# Altium project Stepper_Breakout.PrjPcb (part 1 of 2)
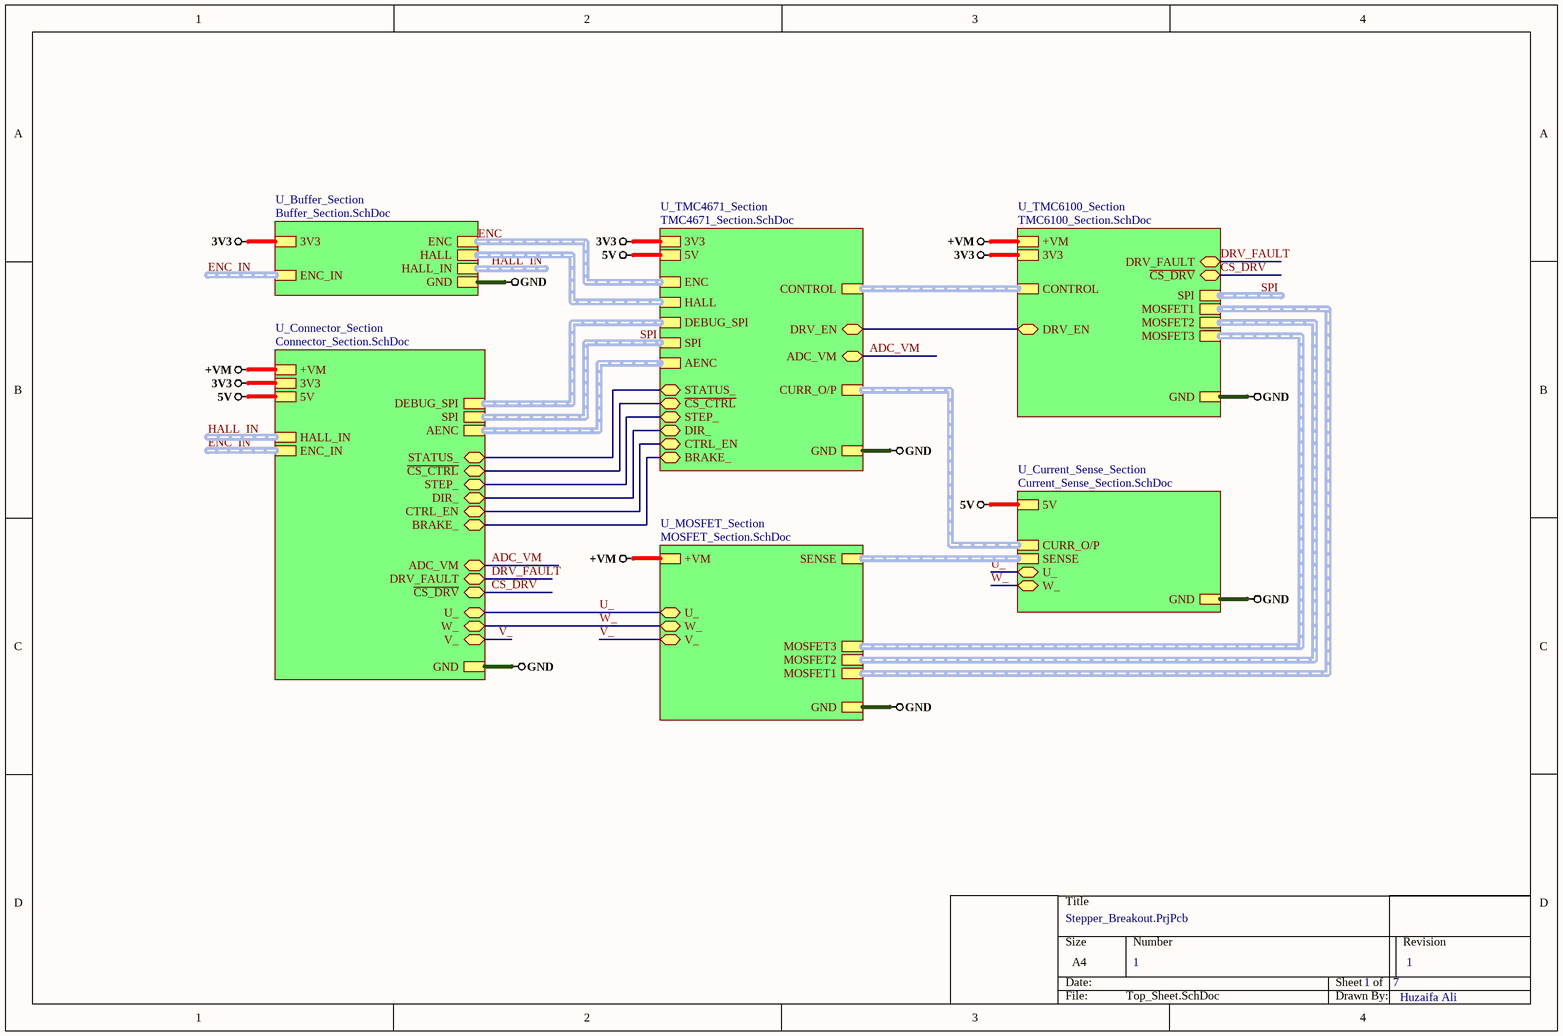
[diagram p0: Top_Sheet.SchDoc]
7 sheets, 115 parts. Net scope: hierarchical (ports join the sheet entries above them; power ports are global).
Board file: Step..._Breakout.PcbDoc
Sheets:
  Top_Sheet.SchDoc
    U_Buffer_Section = Buffer_Section.SchDoc
    U_Connector_Section = Connector_Section.SchDoc
    U_Current_Sense_Section = Current_Sense_Section.SchDoc
    U_MOSFET_Section = MOSFET_Section.SchDoc
    U_TMC4671_Section = TMC4671_Section.SchDoc
    U_TMC6100_Section = TMC6100_Section.SchDoc

## Sheet Top_Sheet.SchDoc: =Projectname
size A4; SheetNumber: 1; SheetTotal: 7

### Sub-sheets
U_Buffer_Section = Buffer_Section.SchDoc: ENC (harness ENC), HALL (harness HALL), 3V3, GND, HALL_IN (harness HALL_IN), ENC_IN (harness ENC_IN)
U_Connector_Section = Connector_Section.SchDoc: BRAKE_ (bidir), STEP_ (bidir), DIR_ (bidir), CTRL_EN (bidir), U_ (bidir), W_ (bidir), DEBUG_SPI (harness DEBUG_SPI), SPI (harness SPI), ~{CS_CTRL} (bidir), ~{CS_DRV} (bidir), STATUS_ (bidir), DRV_FAULT (bidir), AENC (harness AENC), +VM, 3V3, GND, 5V, HALL_IN (harness HALL_IN), ENC_IN (harness ENC_IN), V_ (bidir), ADC_VM (bidir)
U_Current_Sense_Section = Current_Sense_Section.SchDoc: CURR_O/P (harness CURR_O/P), 5V, GND, SENSE (harness SENSE), U_ (bidir), W_ (bidir)
U_MOSFET_Section = MOSFET_Section.SchDoc: MOSFET1 (harness MOSFET1), MOSFET2 (harness MOSFET2), MOSFET3 (harness MOSFET3), SENSE (harness SENSE), U_ (bidir), W_ (bidir), V_ (bidir), +VM, GND
U_TMC4671_Section = TMC4671_Section.SchDoc: STATUS_ (bidir), BRAKE_ (bidir), ~{CS_CTRL} (bidir), STEP_ (bidir), DIR_ (bidir), CTRL_EN (bidir), DEBUG_SPI (harness DEBUG_SPI), SPI (harness SPI), ENC (harness ENC), HALL (harness HALL), 5V, 3V3, GND, CURR_O/P (harness CURR_O/P), AENC (harness AENC), CONTROL (harness CONTROL), DRV_EN (bidir), ADC_VM (bidir)
U_TMC6100_Section = TMC6100_Section.SchDoc: SPI (harness SPI), CONTROL (harness CONTROL), DRV_FAULT (bidir), ~{CS_DRV} (bidir), MOSFET1 (harness MOSFET1), MOSFET2 (harness MOSFET2), MOSFET3 (harness MOSFET3), DRV_EN (bidir), +VM, 3V3, GND

### Nets
3V3: sheet U_Buffer_Section/3V3, sheet U_Connector_Section/3V3, sheet U_TMC4671_Section/3V3, sheet U_TMC6100_Section/3V3
5V: sheet U_Connector_Section/5V, sheet U_Current_Sense_Section/5V, sheet U_TMC4671_Section/5V
+VM: sheet U_Connector_Section/+VM, sheet U_MOSFET_Section/+VM, sheet U_TMC6100_Section/+VM
GND: sheet U_Buffer_Section/GND, sheet U_Connector_Section/GND, sheet U_Current_Sense_Section/GND, sheet U_MOSFET_Section/GND, sheet U_TMC4671_Section/GND, sheet U_TMC6100_Section/GND
~{CS_CTRL}: sheet U_Connector_Section/~{CS_CTRL}, sheet U_TMC4671_Section/~{CS_CTRL}
~{CS_DRV}: sheet U_Connector_Section/~{CS_DRV}, sheet U_TMC6100_Section/~{CS_DRV}
ADC_VM: sheet U_Connector_Section/ADC_VM, sheet U_TMC4671_Section/ADC_VM
BRAKE_: sheet U_Connector_Section/BRAKE_, sheet U_TMC4671_Section/BRAKE_
CTRL_EN: sheet U_Connector_Section/CTRL_EN, sheet U_TMC4671_Section/CTRL_EN
DIR_: sheet U_Connector_Section/DIR_, sheet U_TMC4671_Section/DIR_
DRV_EN: sheet U_TMC4671_Section/DRV_EN, sheet U_TMC6100_Section/DRV_EN
DRV_FAULT: sheet U_Connector_Section/DRV_FAULT, sheet U_TMC6100_Section/DRV_FAULT
STATUS_: sheet U_Connector_Section/STATUS_, sheet U_TMC4671_Section/STATUS_
STEP_: sheet U_Connector_Section/STEP_, sheet U_TMC4671_Section/STEP_
U_: sheet U_Connector_Section/U_, sheet U_Current_Sense_Section/U_, sheet U_MOSFET_Section/U_
V_: sheet U_Connector_Section/V_, sheet U_MOSFET_Section/V_
W_: sheet U_Connector_Section/W_, sheet U_Current_Sense_Section/W_, sheet U_MOSFET_Section/W_

### Buses and harness runs
harness ENC = sheet U_Buffer_Section/ENC = sheet U_TMC4671_Section/ENC
harness ENC_IN = sheet U_Buffer_Section/ENC_IN
harness ENC_IN = sheet U_Connector_Section/ENC_IN
harness HALL_IN = sheet U_Buffer_Section/HALL_IN
harness HALL_IN = sheet U_Connector_Section/HALL_IN
harness sheet U_Buffer_Section/HALL = sheet U_TMC4671_Section/HALL
harness sheet U_Connector_Section/AENC = sheet U_TMC4671_Section/AENC
harness sheet U_Connector_Section/DEBUG_SPI = sheet U_TMC4671_Section/DEBUG_SPI
harness sheet U_Current_Sense_Section/CURR_O/P = sheet U_TMC4671_Section/CURR_O/P
harness sheet U_Current_Sense_Section/SENSE = sheet U_MOSFET_Section/SENSE
harness sheet U_MOSFET_Section/MOSFET1 = sheet U_TMC6100_Section/MOSFET1
harness sheet U_MOSFET_Section/MOSFET2 = sheet U_TMC6100_Section/MOSFET2
harness sheet U_MOSFET_Section/MOSFET3 = sheet U_TMC6100_Section/MOSFET3
harness sheet U_TMC4671_Section/CONTROL = sheet U_TMC6100_Section/CONTROL
harness SPI = sheet U_Connector_Section/SPI = sheet U_TMC4671_Section/SPI
harness SPI = sheet U_TMC6100_Section/SPI

### Notes on the sheet
- 1
- Huzaifa Ali

## Sheet Buffer_Section.SchDoc
size A; SheetNumber: 6; SheetTotal: 7
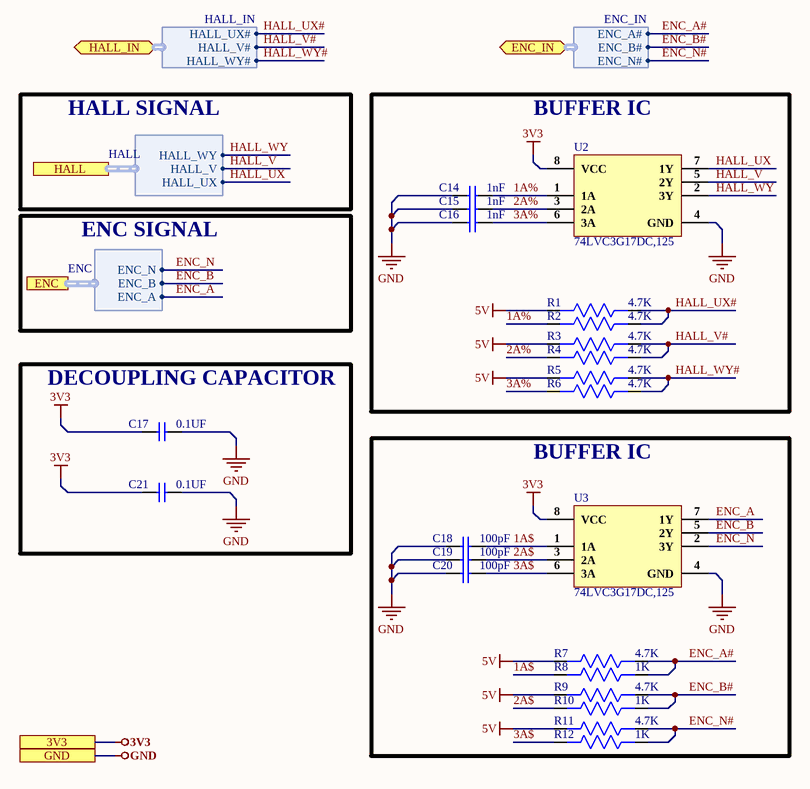
[diagram p1: Buffer_Section.SchDoc]

### Parts
C14  1nF  [Cap0603]
C15  1nF  [Cap0603]
C16  1nF  [Cap0603]
C17  0.1UF  [Cap0402]
C18  100pF  [Cap0603]
C19  100pF  [Cap0603]
C20  100pF  [Cap0603]
C21  0.1UF  [Cap0402]
R1  4.7K  [Res0603]
R2  4.7K  [Res0603]
R3  4.7K  [Res0603]
R4  4.7K  [Res0603]
R5  4.7K  [Res0603]
R6  4.7K  [Res0603]
R7  4.7K  [Res0603]
R8  1K  [Res0603]
R9  4.7K  [Res0603]
R10  1K  [Res0603]
R11  4.7K  [Res0603]
R12  1K  [Res0603]
U2  74LVC3G17DC,125  [8-VSSOP]
U3  74LVC3G17DC,125  [8-VSSOP]

### Blocks framed on the sheet
BUFFER IC: C14-C16 R1-R6 U2
DECOUPLING CAPACITOR: C17 C21
BUFFER IC: C18-C20 R7-R12 U3

### Ports
3V3, ENC (harness ENC), ENC_IN (bidir, harness ENC_IN), GND, HALL (harness HALL), HALL_IN (bidir, harness HALL_IN)

### Harnesses
ENC: ENC_N, ENC_B, ENC_A
HALL: HALL_WY, HALL_V, HALL_UX
HALL_IN: HALL_UX#, HALL_V#, HALL_WY#
ENC_IN: ENC_A#, ENC_B#, ENC_N#

### Nets
3V3: C17.1 C21.1 U2.8(VCC) U3.8(VCC) ; port 3V3
5V: R1.2 R3.2 R5.2 R7.2 R9.2 R11.2
GND: C14.1 C15.1 C16.1 C17.2 C18.1 C19.1 C20.1 C21.2 U2.4(GND) U3.4(GND) ; port GND
1A$: C18.2 R8.2 U3.1(1A)
1A%: C14.2 R2.2 U2.1(1A)
2A$: C19.2 R10.2 U3.3(2A)
2A%: C15.2 R4.2 U2.3(2A)
3A$: C20.2 R12.2 U3.6(3A)
3A%: C16.2 R6.2 U2.6(3A)
ENC_A: U3.7(1Y) ; port ENC.ENC_A  [project net ENC.ENC_A]
ENC_A#: R7.1 R8.1 ; port ENC_IN.ENC_A#
ENC_B: U3.5(2Y) ; port ENC.ENC_B  [project net ENC.ENC_B]
ENC_B#: R9.1 R10.1 ; port ENC_IN.ENC_B#
ENC_N: U3.2(3Y) ; port ENC.ENC_N  [project net ENC.ENC_N]
ENC_N#: R11.1 R12.1 ; port ENC_IN.ENC_N#  [project net ENC_IN.ENC_N#]
HALL_UX: U2.7(1Y) ; port HALL.HALL_UX
HALL_UX#: R1.1 R2.1 ; port HALL_IN.HALL_UX#  [project net HALL_IN.HALL_UX#]
HALL_V: U2.5(2Y) ; port HALL.HALL_V
HALL_V#: R3.1 R4.1 ; port HALL_IN.HALL_V#  [project net HALL_IN.HALL_V#]
HALL_WY: U2.2(3Y) ; port HALL.HALL_WY
HALL_WY#: R5.1 R6.1 ; port HALL_IN.HALL_WY#  [project net HALL_IN.HALL_WY#]

### Notes on the sheet
- HALL SIGNAL
- ENC SIGNAL

### Library data of the parts
C14-C16 = CL10B102KC8NNNC: CAP CER 1nF 100V X7R 0603; Manufacturer: Samsung; Material: Ceramic; Tolerance: 10%; Supplier 1: Avnet; Manufacturer Part Number: CL10B102KC8NNNC; RoHS: Yes; Category: Ceramic Capacitors; Stock 1: 184000; Pricing 1: 4000=0.00988, 8000=0.00987, 16000=0.00986, 24000=0.00985, 32000=0.00984, 40000=0.00982, 400000=0.00981 (USD); Mount: Surface Mount; Case/Package: 0603; Case Code (Metric): 1608; Case Code (Imperial): 0603; Contact Plating: Tin; Min Operating Temperature: -55°C; Max Operating Temperature: 125°C; Capacitance: 1nF; Dielectric: X7R; Packaging: Tape and Reel; Package Quantity: 1; Voltage Rating: 100V; Voltage: 100V; Voltage Rating (DC): 100V; Series: CL; Construction: Flat; Length: 1.6mm; Width: 0.031inch; Height: 0.8mm; Thickness: 0.035inch; Depth: 0.8mm; Radiation Hardening: No; Lead Free: Lead Free; RoHS Compliant: Yes; ComponentLink1URL: https://datasheet.ciiva.com/25799/cl10b102kc8nnnc-25799476.pdf?src-supplier=Digi-Key; ComponentLink1Description: https://datasheet.ciiva.com/25799/cl10b102kc8nnnc-25799476.pdf?src-supplier=Digi-Key; ComponentLink2URL: https://datasheet.ciiva.com/29198/458286-da-01-en-vs-kondensator-0603-29198496.pdf?src-supplier=Conrad; ComponentLink2Description: https://datasheet.ciiva.com/29198/458286-da-01-en-vs-kondensator-0603-29198496.pdf?src-supplier=Conrad; ComponentLink3URL: https://datasheet.ciiva.com/26838/getdatasheetpartid-640779-26838395.pdf?src-supplier=Verical; ComponentLink3Description: https://datasheet.ciiva.com/26838/getdatasheetpartid-640779-26838395.pdf?src-supplier=Verical; ComponentLink4URL: https://datasheet.ciiva.com/26310/mlcc-catalogdownload2013-eng-26310266.pdf?src-supplier=Distrelec; ComponentLink4Description: https://datasheet.ciiva.com/26310/mlcc-catalogdownload2013-eng-26310266.pdf?src-supplier=Distrelec; ComponentLink5URL: https://datasheet.ciiva.com/16199/cl05b104kq5nnnc-16199246.pdf?src-supplier=Future+Electronics; ComponentLink5Description: https://datasheet.ciiva.com/16199/cl05b104kq5nnnc-16199246.pdf?src-supplier=Future+Electronics; Supplier Part Number 1: CL10B102KC8NNNC
C17 C21 = CL05B104KB54PNC: CAP CER 0.1UF 50V X7R 0402; Manufacturer: Samsung; Supplier 1: Digi-Key; Manufacturer Part Number: CL05B104KB54PNC; Stock 1: 8594; Pricing 1: 1=0.1, 10=0.067, 50=0.0366, 100=0.0299, 500=0.02138, 1000=0.01681, 2500=0.01528, 5000=0.01406 (USD); Supplier Part Number 1: 1276-CL05B104KB54PNCDKR-ND
C18-C20 = GRM1885C1H101JA01D: CAP CER 100PF 50V C0G/NP0 0603; Manufacturer: Murata; Material: Ceramic; Tolerance: 5%; Dielectric: C0G; Insulation Resistance: 10GR; Temperature Coefficient: 30ppm/°C; Supplier 1: Arrow Electronics; Manufacturer Part Number: GRM1885C1H101JA01D; RoHS: Yes; Category: Ceramic Capacitors; Stock 1: 3884000; Pricing 1: 4000=0.03790, 8000=0.03760, 12000=0.03720, 40000=0.02940 (USD); Mount: Surface Mount; Case/Package: 0603; Number of Pins: 2; Case Code (Metric): 1608; Case Code (Imperial): 0603; Weight: 7.1E-05oz; Dielectric Material: Ceramic; Min Operating Temperature: -55°C; Max Operating Temperature: 125°C; Capacitance: 100pF; Voltage Rating: 50V; Packaging: Tape and Reel; Package Quantity: 1; Voltage Rating (DC): 50V; Termination: SMD/SMT; Voltage: 50V; Length: 1.6mm; Width: 0.031inch; Height: 0.8mm; Thickness: 0.035inch; Depth: 0.8mm; Radiation Hardening: No; REACH SVHC: Unknown; Lead Free: Lead Free; RoHS Compliant: Yes; ComponentLink1URL: https://datasheet.ciiva.com/131/product-131088.pdf?src-supplier=Digi-Key; ComponentLink1Description: https://datasheet.ciiva.com/131/product-131088.pdf?src-supplier=Digi-Key; ComponentLink2URL: https://datasheet.ciiva.com/3777/grm1885c1h101ja0123-3777264.pdf?src-supplier=Arrow+Electronics; ComponentLink2Description: https://datasheet.ciiva.com/3777/grm1885c1h101ja0123-3777264.pdf?src-supplier=Arrow+Electronics; ComponentLink3URL: https://datasheet.ciiva.com/18100/getdatasheetpartid-26823-18100641.pdf?src-supplier=Verical; ComponentLink3Description: https://datasheet.ciiva.com/18100/getdatasheetpartid-26823-18100641.pdf?src-supplier=Verical; ComponentLink4URL: https://datasheet.ciiva.com/29149/450134-da-01-en-vs-kondensator-0603-29149008.pdf?src-supplier=Conrad; ComponentLink4Description: https://datasheet.ciiva.com/29149/450134-da-01-en-vs-kondensator-0603-29149008.pdf?src-supplier=Conrad; ComponentLink5URL: https://datasheet.ciiva.com/7828/4360-7828890.pdf?src-supplier=Element14; ComponentLink5Description: https://datasheet.ciiva.com/7828/4360-7828890.pdf?src-supplier=Element14; ComponentLink6URL: https://datasheet.ciiva.com/14116/grmseries-tc-hitype-eng-14116815.pdf?src-supplier=Distrelec; ComponentLink6Description: https://datasheet.ciiva.com/14116/grmseries-tc-hitype-eng-14116815.pdf?src-supplier=Distrelec; ComponentLink7URL: https://datasheet.ciiva.com/14116/grmseries-tc-hitype-eng-14116828.pdf?src-supplier=Distrelec; ComponentLink7Description: https://datasheet.ciiva.com/14116/grmseries-tc-hitype-eng-14116828.pdf?src-supplier=Distrelec; ComponentLink8URL: https://datasheet.ciiva.com/28556/4360-28556551.pdf?src-supplier=Element14; ComponentLink8Description: https://datasheet.ciiva.com/28556/4360-28556551.pdf?src-supplier=Element14; ComponentLink9URL: https://datasheet.ciiva.com/131/partnumbering-e-01-131087.pdf?src-supplier=Digi-Key; ComponentLink9Description: https://datasheet.ciiva.com/131/partnumbering-e-01-131087.pdf?src-supplier=Digi-Key; ComponentLink10URL: https://datasheet.ciiva.com/131/partnumbering-e-01-131089.pdf?src-supplier=Digi-Key; ComponentLink10Description: https://datasheet.ciiva.com/131/partnumbering-e-01-131089.pdf?src-supplier=Digi-Key; ComponentLink11URL: https://datasheet.ciiva.com/7828/4360-7828889.pdf?src-supplier=Element14; ComponentLink11Description: https://datasheet.ciiva.com/7828/4360-7828889.pdf?src-supplier=Element14; ComponentLink12URL: https://datasheet.ciiva.com/7828/4360-7828891.pdf?src-supplier=Element14; ComponentLink12Description: https://datasheet.ciiva.com/7828/4360-7828891.pdf?src-supplier=Element14; ComponentLink13URL: https://datasheet.ciiva.com/11605/c02e-11605557.pdf?src-supplier=Avnet; ComponentLink13Description: https://datasheet.ciiva.com/11605/c02e-11605557.pdf?src-supplier=Avnet; ComponentLink14URL: https://datasheet.ciiva.com/16291/product-16291613.pdf?src-supplier=Future+Electronics; ComponentLink14Description: https://datasheet.ciiva.com/16291/product-16291613.pdf?src-supplier=Future+Electronics; Supplier Part Number 1: GRM1885C1H101JA01D
R1-R7 R9 R11 = RC0603FR-074K7L: RES SMD 4.7K OHM 1% 1/10W 0603; Manufacturer: Yageo; Resistance: 4.7kR; Temperature Coefficient: 100ppm/°C; Power Rating: 100mW; Voltage Rating (DC): 50V; Supplier 1: Digi-Key; Manufacturer Part Number: RC0603FR-074K7L; Stock 1: 5337567; Pricing 1: 1=0.1, 10=0.023, 100=0.0094, 1000=0.00421, 2500=0.00366 (USD); Case/Package: 0603; Number of Pins: 2; Case Code (Imperial): 0603; Case Code (Metric): 1608; Min Operating Temperature: -55°C; Max Operating Temperature: 155°C; Tolerance: 1%; Composition: Thick Film; Packaging: Tape and Reel; Voltage Rating: 50V; Termination: SMD/SMT; Military Standard: Not; Length: 1.6mm; Height: 0.45mm; Width: 0.8mm; Depth: 0.8mm; Lead Pitch: 0.3mm; REACH SVHC: No SVHC; Lead Free: Lead Free; ComponentLink1URL: https://www.verical.com/server-webapp/html/getDatasheet?partID=422754&src-supplier=Verical; ComponentLink1Description: https://www.verical.com/server-webapp/html/getDatasheet?partID=422754&src-supplier=Verical; ComponentLink2URL: http://www.farnell.com/datasheets/2167052.pdf?src-supplier=Element14; ComponentLink2Description: http://www.farnell.com/datasheets/2167052.pdf?src-supplier=Element14; ComponentLink3URL: http://www.farnell.com/datasheets/38590.pdf?src-supplier=Element14; ComponentLink3Description: http://www.farnell.com/datasheets/38590.pdf?src-supplier=Element14; ComponentLink4URL: http://www.farnell.com/datasheets/1868787.pdf?src-supplier=Element14; ComponentLink4Description: http://www.farnell.com/datasheets/1868787.pdf?src-supplier=Element14; Supplier Part Number 1: 311-4.70KHRCT-ND
R8 R10 R12 = RC0603FR-071KL: RES SMD 1K OHM 1% 1/10W 0603; Manufacturer: Yageo; Resistance: 1kR; Temperature Coefficient: 100ppm/°C; Power Rating: 100mW; Voltage Rating: 50V; ComponentLink1URL: https://www.verical.com/server-webapp/html/getDatasheet?partID=409289&src-supplier=Verical; ComponentLink1Description: https://www.verical.com/server-webapp/html/getDatasheet?partID=409289&src-supplier=Verical; Supplier 1: Digi-Key; Manufacturer Part Number: RC0603FR-071KL; Stock 1: 21472395; Pricing 1: 1=0.1, 10=0.023, 100=0.0094, 1000=0.0042, 2500=0.0037 (USD); Case/Package: 0603; Contact Plating: Tin,Matte; Case Code (Imperial): 0603; Case Code (Metric): 1608; Min Operating Temperature: -55°C; Max Operating Temperature: 155°C; Tolerance: 1%; Composition: Thick Film; Packaging: Tape and Reel; Termination: SMD/SMT; Military Standard: Not; Length: 1.6mm; Height: 0.45mm; Depth: 0.8mm; Radiation Hardening: No; REACH SVHC: No SVHC; Lead Free: Lead Free; ComponentLink2URL: http://documents.rs-components.com/techlib://itc_doclist_GB.htm?stockno=5048928&src-supplier=RSComponents; ComponentLink2Description: http://documents.rs-components.com/techlib://itc_doclist_GB.htm?stockno=5048928&src-supplier=RSComponents; ComponentLink3URL: http://www.yageo.com/documents/recent/PYu-RC0603_51_RoHS_L_4.pdf?src-supplier=Avnet+Europe; ComponentLink3Description: http://www.yageo.com/documents/recent/PYu-RC0603_51_RoHS_L_4.pdf?src-supplier=Avnet+Europe; ComponentLink4URL: http://www.farnell.com/datasheets/2167052.pdf?src-supplier=Element14; ComponentLink4Description: http://www.farnell.com/datasheets/2167052.pdf?src-supplier=Element14; ComponentLink5URL: http://www.farnell.com/datasheets/1868787.pdf?src-supplier=Element14; ComponentLink5Description: http://www.farnell.com/datasheets/1868787.pdf?src-supplier=Element14; ComponentLink6URL: http://www.yageo.com/documents/recent/PYu-RC_Group_51_RoHS_L_2.pdf?src-supplier=Avnet; ComponentLink6Description: http://www.yageo.com/documents/recent/PYu-RC_Group_51_RoHS_L_2.pdf?src-supplier=Avnet; ComponentLink7URL: https://www.verical.com/server-webapp/html/getDatasheet?partID=404327&src-supplier=Verical; ComponentLink7Description: https://www.verical.com/server-webapp/html/getDatasheet?partID=404327&src-supplier=Verical; ComponentLink8URL: http://www.farnell.com/datasheets/443971.pdf?src-supplier=Element14; ComponentLink8Description: http://www.farnell.com/datasheets/443971.pdf?src-supplier=Element14; Supplier Part Number 1: 311-1.00KHRDKR-ND
U2 U3 = 74LVC3G17DC,125: IC BUFF SCHMT TRG TRPL 8VSSOP; Manufacturer: NXP Semiconductors; Manufacturer Part Number: 74LVC3G17DC125; Max Supply Voltage: 5.5V; Min Supply Voltage: 1.65V; Propagation Delay: 13.1ns; Low Level Output Current: 32mA; Number of Input Lines: 3; Polarity: Non-Inverting; Logic Function: Schmitt Trigger,Buffer; Number of Bits per Element: 1; Quiescent Current: 40uA; Supplier 1: Digi-Key; RoHS: Yes; Category: Clock Buffers, Drivers; Mount: Surface Mount; Case/Package: VSSOP; Number of Pins: 8; Contact Plating: Gold; Min Operating Temperature: -40°C; Max Operating Temperature: 125°C; Packaging: Tape and Reel; Package Quantity: 3000; Number of Output Lines: 3; High Level Output Current: 32mA; Number of Channels: 3; Number of Inputs: 3; Number of Outputs: 3; Number of Elements: 3; Turn-On Delay Time: 13.1ns; Series: 74LVC; Technology: CMOS; Radiation Hardening: No; Lead Free: Lead Free; ComponentLink1URL: https://datasheet.ciiva.com/1839/74lvc3g17-1839116.pdf?src-supplier=Digi-Key; ComponentLink1Description: https://datasheet.ciiva.com/1839/74lvc3g17-1839116.pdf?src-supplier=Digi-Key; ComponentLink2URL: https://datasheet.ciiva.com/1839/74lvc3g17-1839115.pdf?src-supplier=Digi-Key; ComponentLink2Description: https://datasheet.ciiva.com/1839/74lvc3g17-1839115.pdf?src-supplier=Digi-Key; ComponentLink3URL: https://datasheet.ciiva.com/1839/74lvc3g17-1839117.pdf?src-supplier=Digi-Key; ComponentLink3Description: https://datasheet.ciiva.com/1839/74lvc3g17-1839117.pdf?src-supplier=Digi-Key; ComponentLink4URL: https://datasheet.ciiva.com/8260/74lvc3g17-8260965.pdf?src-supplier=Avnet; ComponentLink4Description: https://datasheet.ciiva.com/8260/74lvc3g17-8260965.pdf?src-supplier=Avnet; Supplier Part Number 1: 568-9369-2-ND

## Sheet Connector_Section.SchDoc: =Projectname
size A4; SheetNumber: 7; SheetTotal: 7
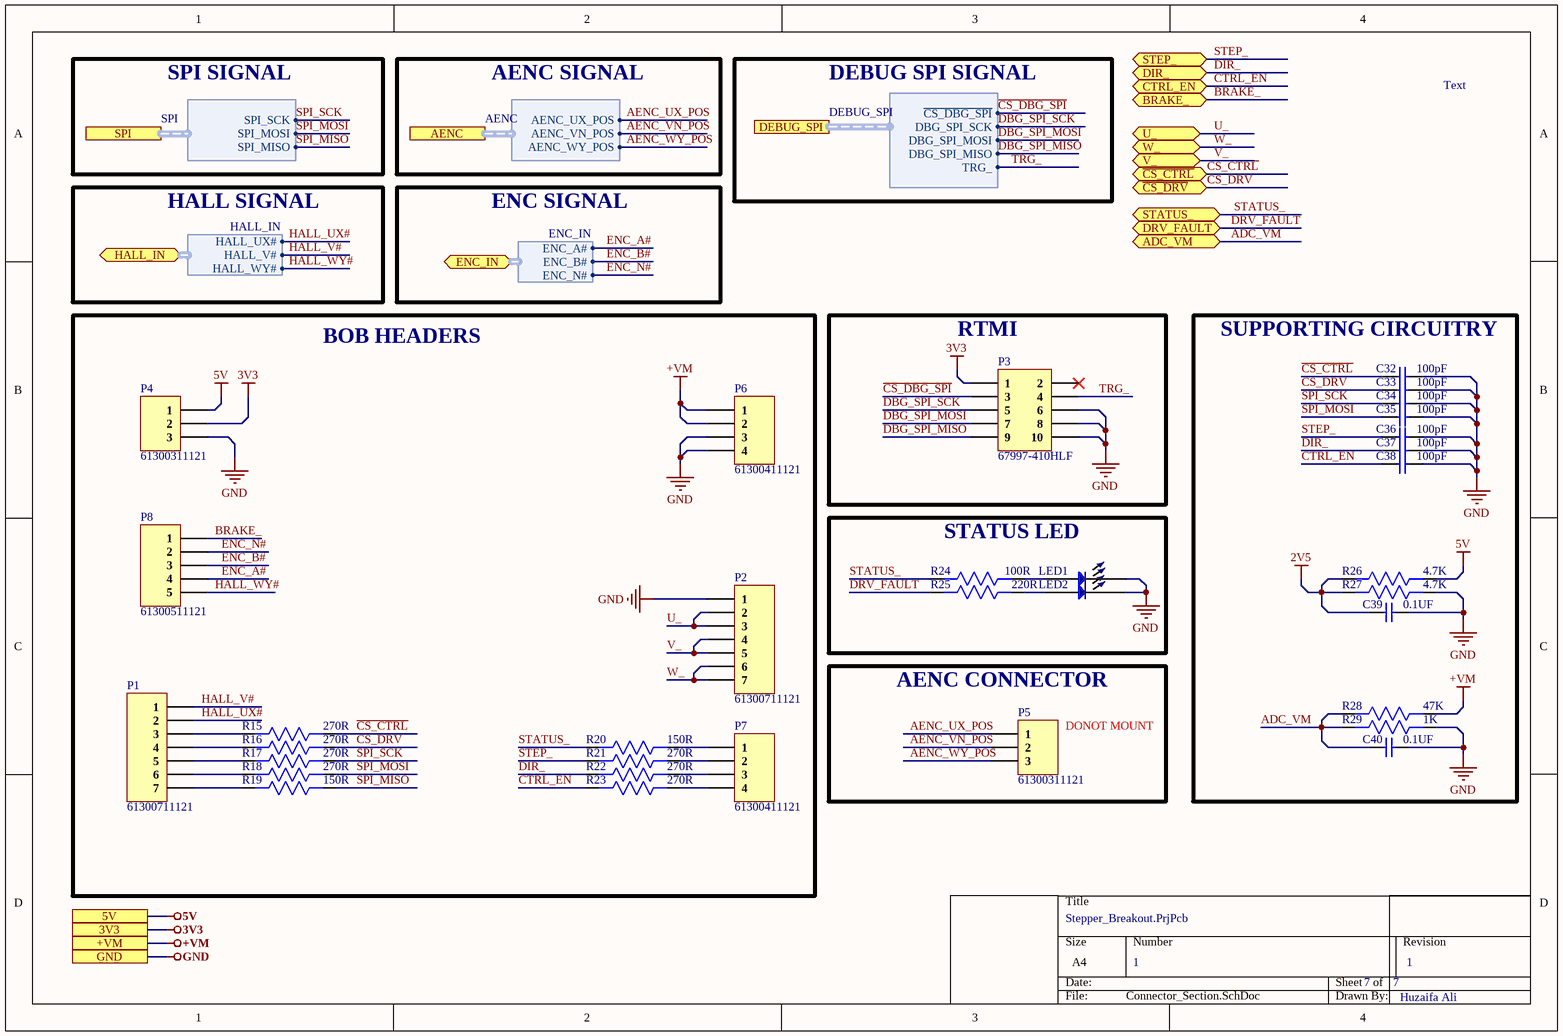
[diagram p2: Connector_Section.SchDoc]

### Parts
C32  100pF  [Cap0603]
C33  100pF  [Cap0603]
C34  100pF  [Cap0603]
C35  100pF  [Cap0603]
C36  100pF  [Cap0603]
C37  100pF  [Cap0603]
C38  100pF  [Cap0603]
C39  0.1UF  [Cap0402]
C40  0.1UF  [Cap0402]
LED1  D-060306B1  [LED 0603]  (value not drawn)
LED2  TJ-S1005SW4TGLC2R-A5  [LED 0402]  (value not drawn)
P1  61300711121  [HDR1X7]
P2  61300711121  [HDR1X7]
P3  67997-410HLF  [HDR2X5]
P4  61300311121  [HDR1X3]
P5  61300311121  [HDR1X3]
P6  61300411121  [HDR1X4]
P7  61300411121  [HDR1X4]
P8  61300511121  [HDR1X5]
R15  270R  [Res0603]
R16  270R  [Res0603]
R17  270R  [Res0603]
R18  270R  [Res0603]
R19  150R  [Res0603]
R20  150R  [Res0603]
R21  270R  [Res0603]
R22  270R  [Res0603]
R23  270R  [Res0603]
R24  100R  [Res0402]
R25  220R  [Res0603]
R26  4.7K  [Res0603]
R27  4.7K  [Res0603]
R28  47K  [Res0603]
R29  1K  [Res0603]

### Blocks framed on the sheet
BOB HEADERS: P1 P2 P4 P6-P8 R15-R23
RTMI: P3
SUPPORTING CIRCUITRY: C32-C40 R26-R29
STATUS LED: LED1 LED2 R24 R25
AENC CONNECTOR: P5

### Ports
3V3, 5V, +VM, ADC_VM (bidir), AENC (harness AENC), BRAKE_ (bidir), CTRL_EN (bidir), DEBUG_SPI (harness DEBUG_SPI), DIR_ (bidir), DRV_FAULT (bidir), ENC_IN (bidir, harness ENC_IN), GND, HALL_IN (bidir, harness HALL_IN), SPI (harness SPI), STATUS_ (bidir), STEP_ (bidir), U_ (bidir), V_ (bidir), W_ (bidir), ~{CS_CTRL} (bidir), ~{CS_DRV} (bidir)

### Harnesses
DEBUG_SPI: ~{CS_DBG_SPI}, DBG_SPI_SCK, DBG_SPI_MOSI, DBG_SPI_MISO, TRG_
SPI: SPI_SCK, SPI_MOSI, SPI_MISO
AENC: AENC_UX_POS, AENC_VN_POS, AENC_WY_POS
HALL_IN: HALL_UX#, HALL_V#, HALL_WY#
ENC_IN: ENC_A#, ENC_B#, ENC_N#

### Nets
2V5: C39.1 R26.2 R27.2
3V3: P3.1 P4.2 ; port 3V3
5V: P4.1 R26.1 ; port 5V
+VM: P6.1 P6.2 R28.1 ; port +VM
GND: C32.2 C33.2 C34.2 C35.2 C36.2 C37.2 C38.2 C39.2 C40.2 LED1.2 LED2.2 P2.1 P3.6 P3.8 P3.10 P4.3 P6.3 P6.4 R27.1 R29.1 ; port GND
~{CS_CTRL}: C32.1 R15.1 ; port ~{CS_CTRL}
~{CS_DBG_SPI}: P3.3 ; port DEBUG_SPI.~{CS_DBG_SPI}
~{CS_DRV}: C33.1 R16.1 ; port ~{CS_DRV}
ADC_VM: C40.1 R28.2 R29.2 ; port ADC_VM
AENC_UX_POS: P5.1 ; port AENC.AENC_UX_POS
AENC_VN_POS: P5.2 ; port AENC.AENC_VN_POS
AENC_WY_POS: P5.3 ; port AENC.AENC_WY_POS
BRAKE_: P8.1 ; port BRAKE_
CTRL_EN: C38.1 R23.2 ; port CTRL_EN
DBG_SPI_MISO: P3.9 ; port DEBUG_SPI.DBG_SPI_MISO
DBG_SPI_MOSI: P3.7 ; port DEBUG_SPI.DBG_SPI_MOSI
DBG_SPI_SCK: P3.5 ; port DEBUG_SPI.DBG_SPI_SCK
DIR_: C37.1 R22.2 ; port DIR_
DRV_FAULT: R25.2 ; port DRV_FAULT
ENC_A#: P8.4 ; port ENC_IN.ENC_A#
ENC_B#: P8.3 ; port ENC_IN.ENC_B#
ENC_N#: P8.2 ; port ENC_IN.ENC_N#  [project net ENC_IN.ENC_N#]
HALL_UX#: P1.2 ; port HALL_IN.HALL_UX#  [project net HALL_IN.HALL_UX#]
HALL_V#: P1.1 ; port HALL_IN.HALL_V#  [project net HALL_IN.HALL_V#]
HALL_WY#: P8.5 ; port HALL_IN.HALL_WY#  [project net HALL_IN.HALL_WY#]
SPI_MISO: R19.1 ; port SPI.SPI_MISO  [project net SPI.SPI_MISO]
SPI_MOSI: C35.1 R18.1 ; port SPI.SPI_MOSI  [project net SPI.SPI_MOSI]
SPI_SCK: C34.1 R17.1 ; port SPI.SPI_SCK  [project net SPI.SPI_SCK]
STATUS_: R20.2 R24.2 ; port STATUS_
STEP_: C36.1 R21.2 ; port STEP_
TRG_: P3.4 ; port DEBUG_SPI.TRG_
U_: P2.2 P2.3 ; port U_
V_: P2.4 P2.5 ; port V_
W_: P2.6 P2.7 ; port W_
NetLED1_1: LED1.1 R24.1
NetLED2_1: LED2.1 R25.1
NetP1_3: P1.3 R15.2
NetP1_4: P1.4 R16.2
NetP1_5: P1.5 R17.2
NetP1_6: P1.6 R18.2
NetP1_7: P1.7 R19.2
NetP7_1: P7.1 R20.1
NetP7_2: P7.2 R21.1
NetP7_3: P7.3 R22.1
NetP7_4: P7.4 R23.1

Not connected (* = marked no-connect by the designer): P3 2*

### Notes on the sheet
- SPI SIGNAL
- AENC SIGNAL
- DEBUG SPI SIGNAL
- Text
- HALL SIGNAL
- ENC SIGNAL
- (near P5) DONOT MOUNT
- 1
- Huzaifa Ali

### Library data of the parts
C32-C38 = GRM1885C1H101JA01D: as C18 on sheet Buffer_Section; Supplier 1: Arrow Electronics; Manufacturer Part Number: GRM1885C1H101JA01D; RoHS: Yes; Category: Ceramic Capacitors; Stock 1: 3884000; Pricing 1: 4000=0.03790, 8000=0.03760, 12000=0.03720, 40000=0.02940 (USD); Mount: Surface Mount; Case/Package: 0603; Number of Pins: 2; Case Code (Metric): 1608; Case Code (Imperial): 0603; Weight: 7.1E-05oz; Dielectric Material: Ceramic; Min Operating Temperature: -55°C; Max Operating Temperature: 125°C; Capacitance: 100pF; Voltage Rating: 50V; Packaging: Tape and Reel; Package Quantity: 1; Voltage Rating (DC): 50V; Termination: SMD/SMT; Voltage: 50V; Length: 1.6mm; Width: 0.031inch; Height: 0.8mm; Thickness: 0.035inch; Depth: 0.8mm; Radiation Hardening: No; REACH SVHC: Unknown; Lead Free: Lead Free; RoHS Compliant: Yes; ComponentLink1URL: https://datasheet.ciiva.com/131/product-131088.pdf?src-supplier=Digi-Key; ComponentLink1Description: https://datasheet.ciiva.com/131/product-131088.pdf?src-supplier=Digi-Key; ComponentLink2URL: https://datasheet.ciiva.com/3777/grm1885c1h101ja0123-3777264.pdf?src-supplier=Arrow+Electronics; ComponentLink2Description: https://datasheet.ciiva.com/3777/grm1885c1h101ja0123-3777264.pdf?src-supplier=Arrow+Electronics; ComponentLink3URL: https://datasheet.ciiva.com/18100/getdatasheetpartid-26823-18100641.pdf?src-supplier=Verical; ComponentLink3Description: https://datasheet.ciiva.com/18100/getdatasheetpartid-26823-18100641.pdf?src-supplier=Verical; ComponentLink4URL: https://datasheet.ciiva.com/29149/450134-da-01-en-vs-kondensator-0603-29149008.pdf?src-supplier=Conrad; ComponentLink4Description: https://datasheet.ciiva.com/29149/450134-da-01-en-vs-kondensator-0603-29149008.pdf?src-supplier=Conrad; ComponentLink5URL: https://datasheet.ciiva.com/7828/4360-7828890.pdf?src-supplier=Element14; ComponentLink5Description: https://datasheet.ciiva.com/7828/4360-7828890.pdf?src-supplier=Element14; ComponentLink6URL: https://datasheet.ciiva.com/14116/grmseries-tc-hitype-eng-14116815.pdf?src-supplier=Distrelec; ComponentLink6Description: https://datasheet.ciiva.com/14116/grmseries-tc-hitype-eng-14116815.pdf?src-supplier=Distrelec; ComponentLink7URL: https://datasheet.ciiva.com/14116/grmseries-tc-hitype-eng-14116828.pdf?src-supplier=Distrelec; ComponentLink7Description: https://datasheet.ciiva.com/14116/grmseries-tc-hitype-eng-14116828.pdf?src-supplier=Distrelec; ComponentLink8URL: https://datasheet.ciiva.com/28556/4360-28556551.pdf?src-supplier=Element14; ComponentLink8Description: https://datasheet.ciiva.com/28556/4360-28556551.pdf?src-supplier=Element14; ComponentLink9URL: https://datasheet.ciiva.com/131/partnumbering-e-01-131087.pdf?src-supplier=Digi-Key; ComponentLink9Description: https://datasheet.ciiva.com/131/partnumbering-e-01-131087.pdf?src-supplier=Digi-Key; ComponentLink10URL: https://datasheet.ciiva.com/131/partnumbering-e-01-131089.pdf?src-supplier=Digi-Key; ComponentLink10Description: https://datasheet.ciiva.com/131/partnumbering-e-01-131089.pdf?src-supplier=Digi-Key; ComponentLink11URL: https://datasheet.ciiva.com/7828/4360-7828889.pdf?src-supplier=Element14; ComponentLink11Description: https://datasheet.ciiva.com/7828/4360-7828889.pdf?src-supplier=Element14; ComponentLink12URL: https://datasheet.ciiva.com/7828/4360-7828891.pdf?src-supplier=Element14; ComponentLink12Description: https://datasheet.ciiva.com/7828/4360-7828891.pdf?src-supplier=Element14; ComponentLink13URL: https://datasheet.ciiva.com/11605/c02e-11605557.pdf?src-supplier=Avnet; ComponentLink13Description: https://datasheet.ciiva.com/11605/c02e-11605557.pdf?src-supplier=Avnet; ComponentLink14URL: https://datasheet.ciiva.com/16291/product-16291613.pdf?src-supplier=Future+Electronics; ComponentLink14Description: https://datasheet.ciiva.com/16291/product-16291613.pdf?src-supplier=Future+Electronics; Supplier Part Number 1: GRM1885C1H101JA01D
C39 C40 = CL05B104KB54PNC: as C17 on sheet Buffer_Section; Supplier 1: Digi-Key; Manufacturer Part Number: CL05B104KB54PNC; Stock 1: 8594; Pricing 1: 1=0.1, 10=0.067, 50=0.0366, 100=0.0299, 500=0.02138, 1000=0.01681, 2500=0.01528, 5000=0.01406 (USD); Supplier Part Number 1: 1276-CL05B104KB54PNCDKR-ND
LED1 = D-060306B1: blue 0603 Light Emitting Diodes (LED) ROHS; Manufacturer: ARKLED; Manufacturer Part Number: D-060306B1; Footprint: 0603; ComponentLink1Description: LCSC; ComponentLink1URL: https://lcsc.com/product-detail/Light-Emitting-Diodes-span-style-background-color-ff0-LED-span_ARKLED-Wuxi-ARK-Tech-Elec-D-060306B1_C118339.html
LED2 = TJ-S1005SW4TGLC2R-A5: Red 625nm 0402 Light Emitting Diodes (LED) RoHS; Manufacturer: TOGIALED; Manufacturer Part No: TJ-S1005SW4TGLC2R-A5; Package: 0402
P1 P2 = 61300711121: CONN HEADER VERT 7POS 2.54MM; Manufacturer: Wurth Electronics; Number of Positions: 7; Gender: Male; Connector Type: Male Pin; Pitch: 0.1inch; Supplier 1: Digi-Key; Manufacturer Part Number: 61300711121; Stock 1: 4017; Pricing 1: 1=0.37, 10=0.315, 25=0.2632, 50=0.219, 100=0.199, 1000=0.181 (USD); Mount: Through Hole; Contact Plating: Gold; Contact Material: Copper; Color: Black; Number of Rows: 1; Packaging: Bulk; Termination: Solder; Number of Contacts: 7; Contact Mating Length: 0.236inch; REACH SVHC: Unknown; ComponentLink1URL: https://katalog.we-online.de/em/datasheet/6130xx11121.pdf?src-supplier=Digi-Key; ComponentLink1Description: https://katalog.we-online.de/em/datasheet/6130xx11121.pdf?src-supplier=Digi-Key; Supplier Part Number 1: 732-5320-ND
P3 = 67997-410HLF: CONN HEADER VERT 10POS 2.54MM; Manufacturer: Amphenol FCI; Number of Contacts: 10; Current Rating: 3A; Voltage Rating: 1.5kV; Insulation Resistance: 5GR; Gender: Male; Connector Type: Male Pin; Contact Post Length: 3.05mm; Row Spacing: 0.1inch; Supplier 1: Digi-Key; Manufacturer Part Number: 67997-410HLF; Stock 1: 7926; Pricing 1: 1=0.28, 10=0.266, 100=0.1864, 500=0.15982, 1000=0.13318, 5000=0.11415, 10000=0.10654 (USD); Mount: Through Hole; Contact Plating: Tin; Contact Material: Bronze; Color: Black; Housing Color: Black; Housing Material: Thermoplastic; Min Operating Temperature: -65°C; Max Operating Temperature: 125°C; Number of Rows: 2; Termination: Solder; Contact Gender: Male; Package Quantity: 100; Packaging: Bulk; Number of Positions: 10; Max Voltage Rating (AC): 1.5kV; Orientation: Straight; Length: 12.7mm; Pitch: 2.54mm; Contact Mating Length: 0.23inch; Depth: 4.83mm; REACH SVHC: No SVHC; Flammability Rating: UL94 V-0; ComponentLink1URL: http://www.mouser.com/ds/2/154/bus-12-050-356030.pdf?src-supplier=Mouser; ComponentLink1Description: http://www.mouser.com/ds/2/154/bus-12-050-356030.pdf?src-supplier=Mouser; ComponentLink2URL: http://portal.fciconnect.com/Comergent/fci/drawing/67996.pdf?src-supplier=Avnet; ComponentLink2Description: http://portal.fciconnect.com/Comergent/fci/drawing/67996.pdf?src-supplier=Avnet; ComponentLink3URL: https://www.alliedelec.com/m/d/738c41368b909dba4b47243c40762f88.pdf?src-supplier=Allied+Electronics; ComponentLink3Description: https://www.alliedelec.com/m/d/738c41368b909dba4b47243c40762f88.pdf?src-supplier=Allied+Electronics; ComponentLink4URL: https://cdn.amphenol-icc.com/media/wysiwyg/files/drawing/67996.pdf?src-supplier=Digi-Key; ComponentLink4Description: https://cdn.amphenol-icc.com/media/wysiwyg/files/drawing/67996.pdf?src-supplier=Digi-Key; ComponentLink5URL: http://portal.fciconnect.com/Comergent/fci/drawing/67996.pdf?src-supplier=Avnet+Europe; ComponentLink5Description: http://portal.fciconnect.com/Comergent/fci/drawing/67996.pdf?src-supplier=Avnet+Europe; ComponentLink6URL: http://www.farnell.com/datasheets/1748781.pdf?src-supplier=Element14; ComponentLink6Description: http://www.farnell.com/datasheets/1748781.pdf?src-supplier=Element14; Supplier Part Number 1: 609-3243-ND
P4 P5 = 61300311121: CONN HEADER VERT 3POS 2.54MM; Manufacturer: Wurth Electronics; Number of Positions: 3; Gender: Male; Connector Type: Male Pin; Pitch: 0.1inch; Supplier 1: Digi-Key; Manufacturer Part Number: 61300311121; Stock 1: 81286; Pricing 1: 1=0.13, 10=0.106, 25=0.088, 50=0.074, 100=0.067, 1000=0.061 (USD); Mount: Through Hole; Contact Plating: Gold; Contact Material: Copper; Color: Black; Number of Rows: 1; Packaging: Bulk; Termination: Solder; Number of Contacts: 3; Contact Mating Length: 0.236inch; REACH SVHC: Unknown; Lead Free: Lead Free; ComponentLink1URL: http://www.farnell.com/cad/1737268.pdf?src-supplier=Element14; ComponentLink1Description: http://www.farnell.com/cad/1737268.pdf?src-supplier=Element14; ComponentLink2URL: https://katalog.we-online.de/em/datasheet/6130xx11121.pdf?src-supplier=Digi-Key; ComponentLink2Description: https://katalog.we-online.de/em/datasheet/6130xx11121.pdf?src-supplier=Digi-Key; Supplier Part Number 1: 732-5316-ND
P6 P7 = 61300411121: CONN HEADER VERT 4POS 2.54MM; Manufacturer: Wurth Electronics; Number of Positions: 4; Gender: Male; Connector Type: Male Pin; Pitch: 0.1inch; Supplier 1: Digi-Key; Manufacturer Part Number: 61300411121; Stock 1: 20544; Pricing 1: 1=0.18, 10=0.153, 25=0.1272, 50=0.106, 100=0.096, 1000=0.088 (USD); Mount: Through Hole; Contact Plating: Gold; Contact Material: Copper; Color: Black; Number of Rows: 1; Packaging: Bulk; Termination: Solder; Number of Contacts: 4; Contact Mating Length: 0.236inch; REACH SVHC: Unknown; Lead Free: Lead Free; ComponentLink1URL: http://www.farnell.com/cad/1737268.pdf?src-supplier=Element14; ComponentLink1Description: http://www.farnell.com/cad/1737268.pdf?src-supplier=Element14; ComponentLink2URL: https://katalog.we-online.de/em/datasheet/6130xx11121.pdf?src-supplier=Digi-Key; ComponentLink2Description: https://katalog.we-online.de/em/datasheet/6130xx11121.pdf?src-supplier=Digi-Key; Supplier Part Number 1: 732-5317-ND
P8 = 61300511121: CONN HEADER VERT 5POS 2.54MM; Manufacturer: Wurth Electronics; Number of Positions: 5; Gender: Male; Connector Type: Male Pin; Pitch: 0.1inch; Supplier 1: Digi-Key; Manufacturer Part Number: 61300511121; Stock 1: 27960; Pricing 1: 1=0.25, 10=0.209, 25=0.174, 50=0.145, 100=0.132, 1000=0.12 (USD); Mount: Through Hole; Contact Plating: Gold; Contact Material: Copper; Color: Black; Number of Rows: 1; Packaging: Bulk; Termination: Solder; Number of Contacts: 5; Contact Mating Length: 0.236inch; REACH SVHC: Unknown; Lead Free: Lead Free; ComponentLink1URL: https://katalog.we-online.de/em/datasheet/6130xx11121.pdf?src-supplier=Digi-Key; ComponentLink1Description: https://katalog.we-online.de/em/datasheet/6130xx11121.pdf?src-supplier=Digi-Key; ComponentLink2URL: http://www.farnell.com/cad/1737268.pdf?src-supplier=Element14; ComponentLink2Description: http://www.farnell.com/cad/1737268.pdf?src-supplier=Element14; Supplier Part Number 1: 732-5318-ND
R15-R18 R21-R23 = ARG03FTC2700: 270Ω 0603 Chip Resistor - Surface Mount ROHS; Manufacturer: Viking Tech; ComponentLink1Description: LCSC; ComponentLink1URL: https://lcsc.com/product-detail/Chip-span-style-background-color-ff0-Resistor-span-Surface-Mount_Viking-Tech-ARG03FTC2700_C217921.html; Manufacturer Part Number: ARG03FTC2700; Footprint: 0603
R19 R20 = RC0603FR-07150RL: RES SMD 150OHM 1/10W 0603; Manufacturer: Yageo; Tolerance: 1%; Power Rating: 100mW; Voltage Rating (DC): 50V; Temperature Coefficient: 100ppm/°C; Supplier 1: Digi-Key; Manufacturer Part Number: RC0603FR-07150RL; RoHS: Yes; Category: Chip SMD Resistors; Stock 1: 263721; Pricing 1: 1=0.10000, 10=0.02400, 100=0.00970, 1000=0.00436, 2500=0.00378 (USD); Case/Package: 0603; Number of Pins: 2; Case Code (Imperial): 0603; Case Code (Metric): 1608; Size Code: 0603; Min Operating Temperature: -55°C; Max Operating Temperature: 155°C; Resistance: 150R; Packaging: Tape and Reel; Voltage Rating: 50V; Package Quantity: 5000; Termination: SMD/SMT; Resistor Type: Thick Film; Features: Moisture Resistant; Series: RC; Max Power Dissipation: 100mW; Number of Terminations: 2; Resistance Tolerance: 1%; Construction: Rectangular; Length: 1.6mm; Width: 0.8mm; Height: 0.45mm; Depth: 0.8mm; REACH SVHC: No SVHC; Lead Free: Lead Free; Military Standard: Not; RoHS Compliant: Yes; ComponentLink1URL: https://datasheet.ciiva.com/46412/443971-46412844.pdf?src-supplier=Element14; ComponentLink1Description: https://datasheet.ciiva.com/46412/443971-46412844.pdf?src-supplier=Element14; ComponentLink2URL: https://datasheet.ciiva.com/46440/1868787-46440893.pdf?src-supplier=Element14; ComponentLink2Description: https://datasheet.ciiva.com/46440/1868787-46440893.pdf?src-supplier=Element14; ComponentLink3URL: https://datasheet.ciiva.com/12555/rc0603-272842-12555301.pdf?src-supplier=Mouser; ComponentLink3Description: https://datasheet.ciiva.com/12555/rc0603-272842-12555301.pdf?src-supplier=Mouser; Supplier Part Number 1: 311-150HRCT-ND
R24 = RC0402JR-07100RL: RES SMD 100 OHM 5% 1/16W 0402; Manufacturer: Yageo; Power Rating: 63mW; Voltage Rating: 50V; Temperature Coefficient: 100ppm/°C; Supplier 1: Digi-Key; Manufacturer Part Number: RC0402JR-07100RL; Stock 1: 6779400; Pricing 1: 1=0.1, 10=0.013, 100=0.0055, 1000=0.00245, 2500=0.00212, 5000=0.00176 (USD); Case/Package: 0402; Weight: 2.3E-05oz; Case Code (Metric): 1005; Case Code (Imperial): 0402; Min Operating Temperature: -55°C; Max Operating Temperature: 155°C; Resistance: 100R; Tolerance: 5%; Packaging: Tape and Reel; Package Quantity: 1; Composition: Thick Film; Number of Terminations: 2; Termination: SMD/SMT; Military Standard: Not; Max Power Dissipation: 63mW; Features: Moisture Resistant; Length: 1mm; Height: 0.016inch; Width: 0.02inch; Depth: 0.5mm; REACH SVHC: No SVHC; Lead Free: Lead Free; ComponentLink1URL: http://www.farnell.com/datasheets/1018594.pdf?src-supplier=Element14; ComponentLink1Description: http://www.farnell.com/datasheets/1018594.pdf?src-supplier=Element14; ComponentLink2URL: http://www.yageo.com/documents/recent/PYu-RC_Group_51_RoHS_L_10.pdf?src-supplier=Digi-Key; ComponentLink2Description: http://www.yageo.com/documents/recent/PYu-RC_Group_51_RoHS_L_10.pdf?src-supplier=Digi-Key; ComponentLink3URL: http://www.yageo.com/documents/recent/PYu-RC_Group_51_RoHS_L_9.pdf?src-supplier=Digi-Key; ComponentLink3Description: http://www.yageo.com/documents/recent/PYu-RC_Group_51_RoHS_L_9.pdf?src-supplier=Digi-Key; ComponentLink4URL: http://www.yageo.com/documents/recent/PYu-RC0402_51_RoHS_L_6_r.pdf?src-supplier=Future+Electronics; ComponentLink4Description: http://www.yageo.com/documents/recent/PYu-RC0402_51_RoHS_L_6_r.pdf?src-supplier=Future+Electronics; ComponentLink5URL: http://www.mouser.com/ds/2/447/PYu-RC0402_51_RoHS_L_6_r-8721.pdf?src-supplier=Mouser; ComponentLink5Description: http://www.mouser.com/ds/2/447/PYu-RC0402_51_RoHS_L_6_r-8721.pdf?src-supplier=Mouser; Supplier Part Number 1: 311-100JRDKR-ND
R25 = RC0603FR-07220RL: RES SMD 220 OHM 1% 1/10W 0603; Manufacturer: Yageo; Temperature Coefficient: 100ppm/°C; Voltage Rating (DC): 50V; Power Rating: 100mW; Supplier 1: Digi-Key; Manufacturer Part Number: RC0603FR-07220RL; Stock 1: 5843995; Pricing 1: 1=0.1, 10=0.023, 100=0.0094, 1000=0.00421, 2500=0.00366 (USD); Case/Package: 0603; Number of Pins: 2; Case Code (Imperial): 0603; Case Code (Metric): 1608; Min Operating Temperature: -55°C; Max Operating Temperature: 155°C; Resistance: 220R; Tolerance: 1%; Composition: Thick Film; Packaging: Tape and Reel; Voltage Rating: 50V; Package Quantity: 1; Termination: SMD/SMT; Number of Terminations: 2; Military Standard: Not; Max Power Dissipation: 100mW; Features: Moisture Resistant; Length: 1.6mm; Height: 0.022inch; Width: 0.031inch; Depth: 0.8mm; REACH SVHC: No SVHC; Lead Free: Lead Free; ComponentLink1URL: http://www.yageo.com/documents/recent/PYu-RC_Group_51_RoHS_L_10.pdf?src-supplier=Digi-Key; ComponentLink1Description: http://www.yageo.com/documents/recent/PYu-RC_Group_51_RoHS_L_10.pdf?src-supplier=Digi-Key; ComponentLink2URL: http://www.farnell.com/datasheets/1868787.pdf?src-supplier=Element14; ComponentLink2Description: http://www.farnell.com/datasheets/1868787.pdf?src-supplier=Element14; Supplier Part Number 1: 311-220HRCT-ND
R26 R27 = RC0603FR-074K7L: as R1 on sheet Buffer_Section; Supplier 1: Digi-Key; Manufacturer Part Number: RC0603FR-074K7L; Stock 1: 5337567; Pricing 1: 1=0.1, 10=0.023, 100=0.0094, 1000=0.00421, 2500=0.00366 (USD); Case/Package: 0603; Number of Pins: 2; Case Code (Imperial): 0603; Case Code (Metric): 1608; Min Operating Temperature: -55°C; Max Operating Temperature: 155°C; Tolerance: 1%; Composition: Thick Film; Packaging: Tape and Reel; Voltage Rating: 50V; Termination: SMD/SMT; Military Standard: Not; Length: 1.6mm; Height: 0.45mm; Width: 0.8mm; Depth: 0.8mm; Lead Pitch: 0.3mm; REACH SVHC: No SVHC; Lead Free: Lead Free; ComponentLink1URL: https://www.verical.com/server-webapp/html/getDatasheet?partID=422754&src-supplier=Verical; ComponentLink1Description: https://www.verical.com/server-webapp/html/getDatasheet?partID=422754&src-supplier=Verical; ComponentLink2URL: http://www.farnell.com/datasheets/2167052.pdf?src-supplier=Element14; ComponentLink2Description: http://www.farnell.com/datasheets/2167052.pdf?src-supplier=Element14; ComponentLink3URL: http://www.farnell.com/datasheets/38590.pdf?src-supplier=Element14; ComponentLink3Description: http://www.farnell.com/datasheets/38590.pdf?src-supplier=Element14; ComponentLink4URL: http://www.farnell.com/datasheets/1868787.pdf?src-supplier=Element14; ComponentLink4Description: http://www.farnell.com/datasheets/1868787.pdf?src-supplier=Element14; Supplier Part Number 1: 311-4.70KHRCT-ND
R28 = RC0603JR-0747KL: RES SMD 47K OHM 5% 1/10W 0603; Manufacturer: Yageo; Resistance: 47kR; Power Rating: 100mW; Voltage Rating (DC): 50V; Temperature Coefficient: 100ppm/°C; Supplier 1: Arrow; Manufacturer Part Number: RC0603JR-0747KL; Stock 1: 599135; Pricing 1: 5000=0.0025, 10000=0.0022, 25000=0.0019, 1=0.0011, 6000=0.001 (USD); Case/Package: 0603; Number of Pins: 2; Case Code (Imperial): 0603; Case Code (Metric): 1608; Min Operating Temperature: -55°C; Max Operating Temperature: 155°C; Packaging: Tape and Reel; Tolerance: 5%; Voltage Rating: 50V; Package Quantity: 5000; Termination: SMD/SMT; Military Standard: Not; Composition: Thick Film; Length: 1.6mm; Height: 0.45mm; Width: 0.8mm; Depth: 0.8mm; REACH SVHC: No SVHC; Lead Free: Lead Free; ComponentLink1URL: http://www.farnell.com/datasheets/443971.pdf; ComponentLink1Description: http://www.farnell.com/datasheets/443971.pdf; ComponentLink2URL: http://www.mouser.com/catalog/specsheets/RC0603.pdf; ComponentLink2Description: http://www.mouser.com/catalog/specsheets/RC0603.pdf; Supplier Part Number 1: RC0603JR-0747KL
R29 = RC0603FR-071KL: as R8 on sheet Buffer_Section; ComponentLink1URL: https://www.verical.com/server-webapp/html/getDatasheet?partID=409289&src-supplier=Verical; ComponentLink1Description: https://www.verical.com/server-webapp/html/getDatasheet?partID=409289&src-supplier=Verical; Supplier 1: Digi-Key; Manufacturer Part Number: RC0603FR-071KL; Stock 1: 21472395; Pricing 1: 1=0.1, 10=0.023, 100=0.0094, 1000=0.0042, 2500=0.0037 (USD); Case/Package: 0603; Contact Plating: Tin,Matte; Case Code (Imperial): 0603; Case Code (Metric): 1608; Min Operating Temperature: -55°C; Max Operating Temperature: 155°C; Tolerance: 1%; Composition: Thick Film; Packaging: Tape and Reel; Termination: SMD/SMT; Military Standard: Not; Length: 1.6mm; Height: 0.45mm; Depth: 0.8mm; Radiation Hardening: No; REACH SVHC: No SVHC; Lead Free: Lead Free; ComponentLink2URL: http://documents.rs-components.com/techlib://itc_doclist_GB.htm?stockno=5048928&src-supplier=RSComponents; ComponentLink2Description: http://documents.rs-components.com/techlib://itc_doclist_GB.htm?stockno=5048928&src-supplier=RSComponents; ComponentLink3URL: http://www.yageo.com/documents/recent/PYu-RC0603_51_RoHS_L_4.pdf?src-supplier=Avnet+Europe; ComponentLink3Description: http://www.yageo.com/documents/recent/PYu-RC0603_51_RoHS_L_4.pdf?src-supplier=Avnet+Europe; ComponentLink4URL: http://www.farnell.com/datasheets/2167052.pdf?src-supplier=Element14; ComponentLink4Description: http://www.farnell.com/datasheets/2167052.pdf?src-supplier=Element14; ComponentLink5URL: http://www.farnell.com/datasheets/1868787.pdf?src-supplier=Element14; ComponentLink5Description: http://www.farnell.com/datasheets/1868787.pdf?src-supplier=Element14; ComponentLink6URL: http://www.yageo.com/documents/recent/PYu-RC_Group_51_RoHS_L_2.pdf?src-supplier=Avnet; ComponentLink6Description: http://www.yageo.com/documents/recent/PYu-RC_Group_51_RoHS_L_2.pdf?src-supplier=Avnet; ComponentLink7URL: https://www.verical.com/server-webapp/html/getDatasheet?partID=404327&src-supplier=Verical; ComponentLink7Description: https://www.verical.com/server-webapp/html/getDatasheet?partID=404327&src-supplier=Verical; ComponentLink8URL: http://www.farnell.com/datasheets/443971.pdf?src-supplier=Element14; ComponentLink8Description: http://www.farnell.com/datasheets/443971.pdf?src-supplier=Element14; Supplier Part Number 1: 311-1.00KHRDKR-ND